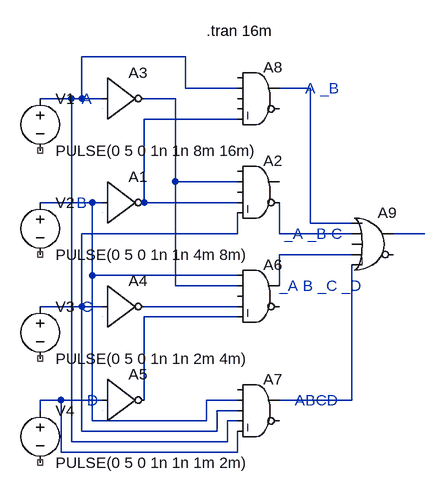
[diagram p0: schematic 14.asc]
14.asc, the LTspice schematic file:
Version 4.1
SHEET 1 880 680
WIRE 272 -80 112 -80
WIRE 272 -32 272 -80
WIRE 352 -32 272 -32
WIRE 464 -32 416 -32
WIRE 96 -16 48 -16
WIRE 112 -16 112 -80
WIRE 112 -16 96 -16
WIRE 144 -16 112 -16
WIRE 256 -16 208 -16
WIRE 352 16 208 16
WIRE 256 112 256 -16
WIRE 352 112 256 112
WIRE 128 144 48 144
WIRE 144 144 128 144
WIRE 208 144 208 16
WIRE 352 144 208 144
WIRE 464 176 464 -32
WIRE 528 176 464 176
WIRE 352 192 352 160
WIRE 352 192 112 192
WIRE 416 192 416 144
WIRE 528 192 416 192
WIRE 640 192 592 192
WIRE 528 224 416 224
WIRE 128 256 128 144
WIRE 352 256 128 256
WIRE 256 272 256 112
WIRE 352 272 256 272
WIRE 416 272 416 224
WIRE 112 304 112 192
WIRE 112 304 48 304
WIRE 144 304 112 304
WIRE 352 304 208 304
WIRE 352 320 208 320
WIRE 80 448 48 448
WIRE 144 448 80 448
WIRE 208 448 208 320
WIRE 352 448 304 448
WIRE 528 448 528 240
WIRE 528 448 416 448
WIRE 48 464 48 448
WIRE 352 464 320 464
WIRE 128 480 128 256
WIRE 304 480 304 448
WIRE 304 480 128 480
WIRE 352 480 336 480
WIRE 112 496 112 304
WIRE 320 496 320 464
WIRE 320 496 112 496
WIRE 96 512 96 -16
WIRE 336 512 336 480
WIRE 336 512 96 512
WIRE 80 528 80 448
WIRE 352 528 352 496
WIRE 352 528 80 528
SYMBOL voltage 48 -32 R0
WINDOW 123 0 0 Left 0
WINDOW 39 0 0 Left 0
SYMATTR InstName V1
SYMATTR Value PULSE(0 5 0 1n 1n 8m 16m)
SYMBOL voltage 48 128 R0
WINDOW 123 0 0 Left 0
WINDOW 39 0 0 Left 0
SYMATTR InstName V2
SYMATTR Value PULSE(0 5 0 1n 1n 4m 8m)
SYMBOL voltage 48 288 R0
WINDOW 123 0 0 Left 0
WINDOW 39 0 0 Left 0
SYMATTR InstName V3
SYMATTR Value PULSE(0 5 0 1n 1n 2m 4m)
SYMBOL voltage 48 448 R0
WINDOW 123 0 0 Left 0
WINDOW 39 0 0 Left 0
SYMATTR InstName V4
SYMATTR Value PULSE(0 5 0 1n 1n 1m 2m)
SYMBOL Digital\\inv 144 80 R0
SYMATTR InstName A1
SYMBOL Digital\\and 384 64 R0
SYMATTR InstName A2
SYMBOL Digital\\inv 144 -80 R0
SYMATTR InstName A3
SYMBOL Digital\\inv 144 240 R0
SYMATTR InstName A4
SYMBOL Digital\\inv 144 384 R0
SYMATTR InstName A5
SYMBOL Digital\\and 384 224 R0
SYMATTR InstName A6
SYMBOL Digital\\and 384 400 R0
SYMATTR InstName A7
SYMBOL Digital\\and 384 -80 R0
SYMATTR InstName A8
SYMBOL Digital\\or 560 144 R0
SYMATTR InstName A9
TEXT 304 -120 Left 2 !.tran 16m
TEXT 112 -16 Left 2 ;A
TEXT 104 144 Left 2 ;B
TEXT 112 304 Left 2 ;C
TEXT 120 448 Left 2 ;D
TEXT 456 -32 Left 2 ;A _B
TEXT 424 192 Left 2 ;_A _B C
TEXT 416 272 Left 2 ;_A B _C _D
TEXT 440 448 Left 2 ;ABCD

The netlist it stands for:
* 14.asc
V1 N001 NC_01 PULSE(0 5 0 1n 1n 8m 16m)
V2 N005 NC_02 PULSE(0 5 0 1n 1n 4m 8m)
V3 N006 NC_03 PULSE(0 5 0 1n 1n 2m 4m)
V4 N012 NC_04 PULSE(0 5 0 1n 1n 1m 2m)
A1 N005 0 0 0 0 N004 0 0 BUF
A2 0 N003 0 N004 N006 N007 0 0 AND
A3 N001 0 0 0 0 N003 0 0 BUF
A4 N006 0 0 0 0 N010 0 0 BUF
A5 N012 0 0 0 0 N011 0 0 BUF
A6 N005 N003 0 N010 N011 0 N009 0 AND
A7 0 N005 N006 N001 N012 0 N013 0 AND
A8 0 N001 0 0 N004 0 N002 0 AND
A9 N002 N007 0 N009 N013 0 N008 0 OR
.tran 16m
* A
* B
* C
* D
* A _B
* _A _B C
* _A B _C _D
* ABCD
.backanno
.end